# EasyEDA Pro project ProProject_F4_2025-05-21.epro, schematic Schematic1
Create Date: 2024-11-06; Page Name: P1; Project Name: 25电赛备赛; Schematic Name: Schematic1; Update Date: 2024-12-28; Company: 嘉立创EDA; Page Size: A4; Version: V1.0
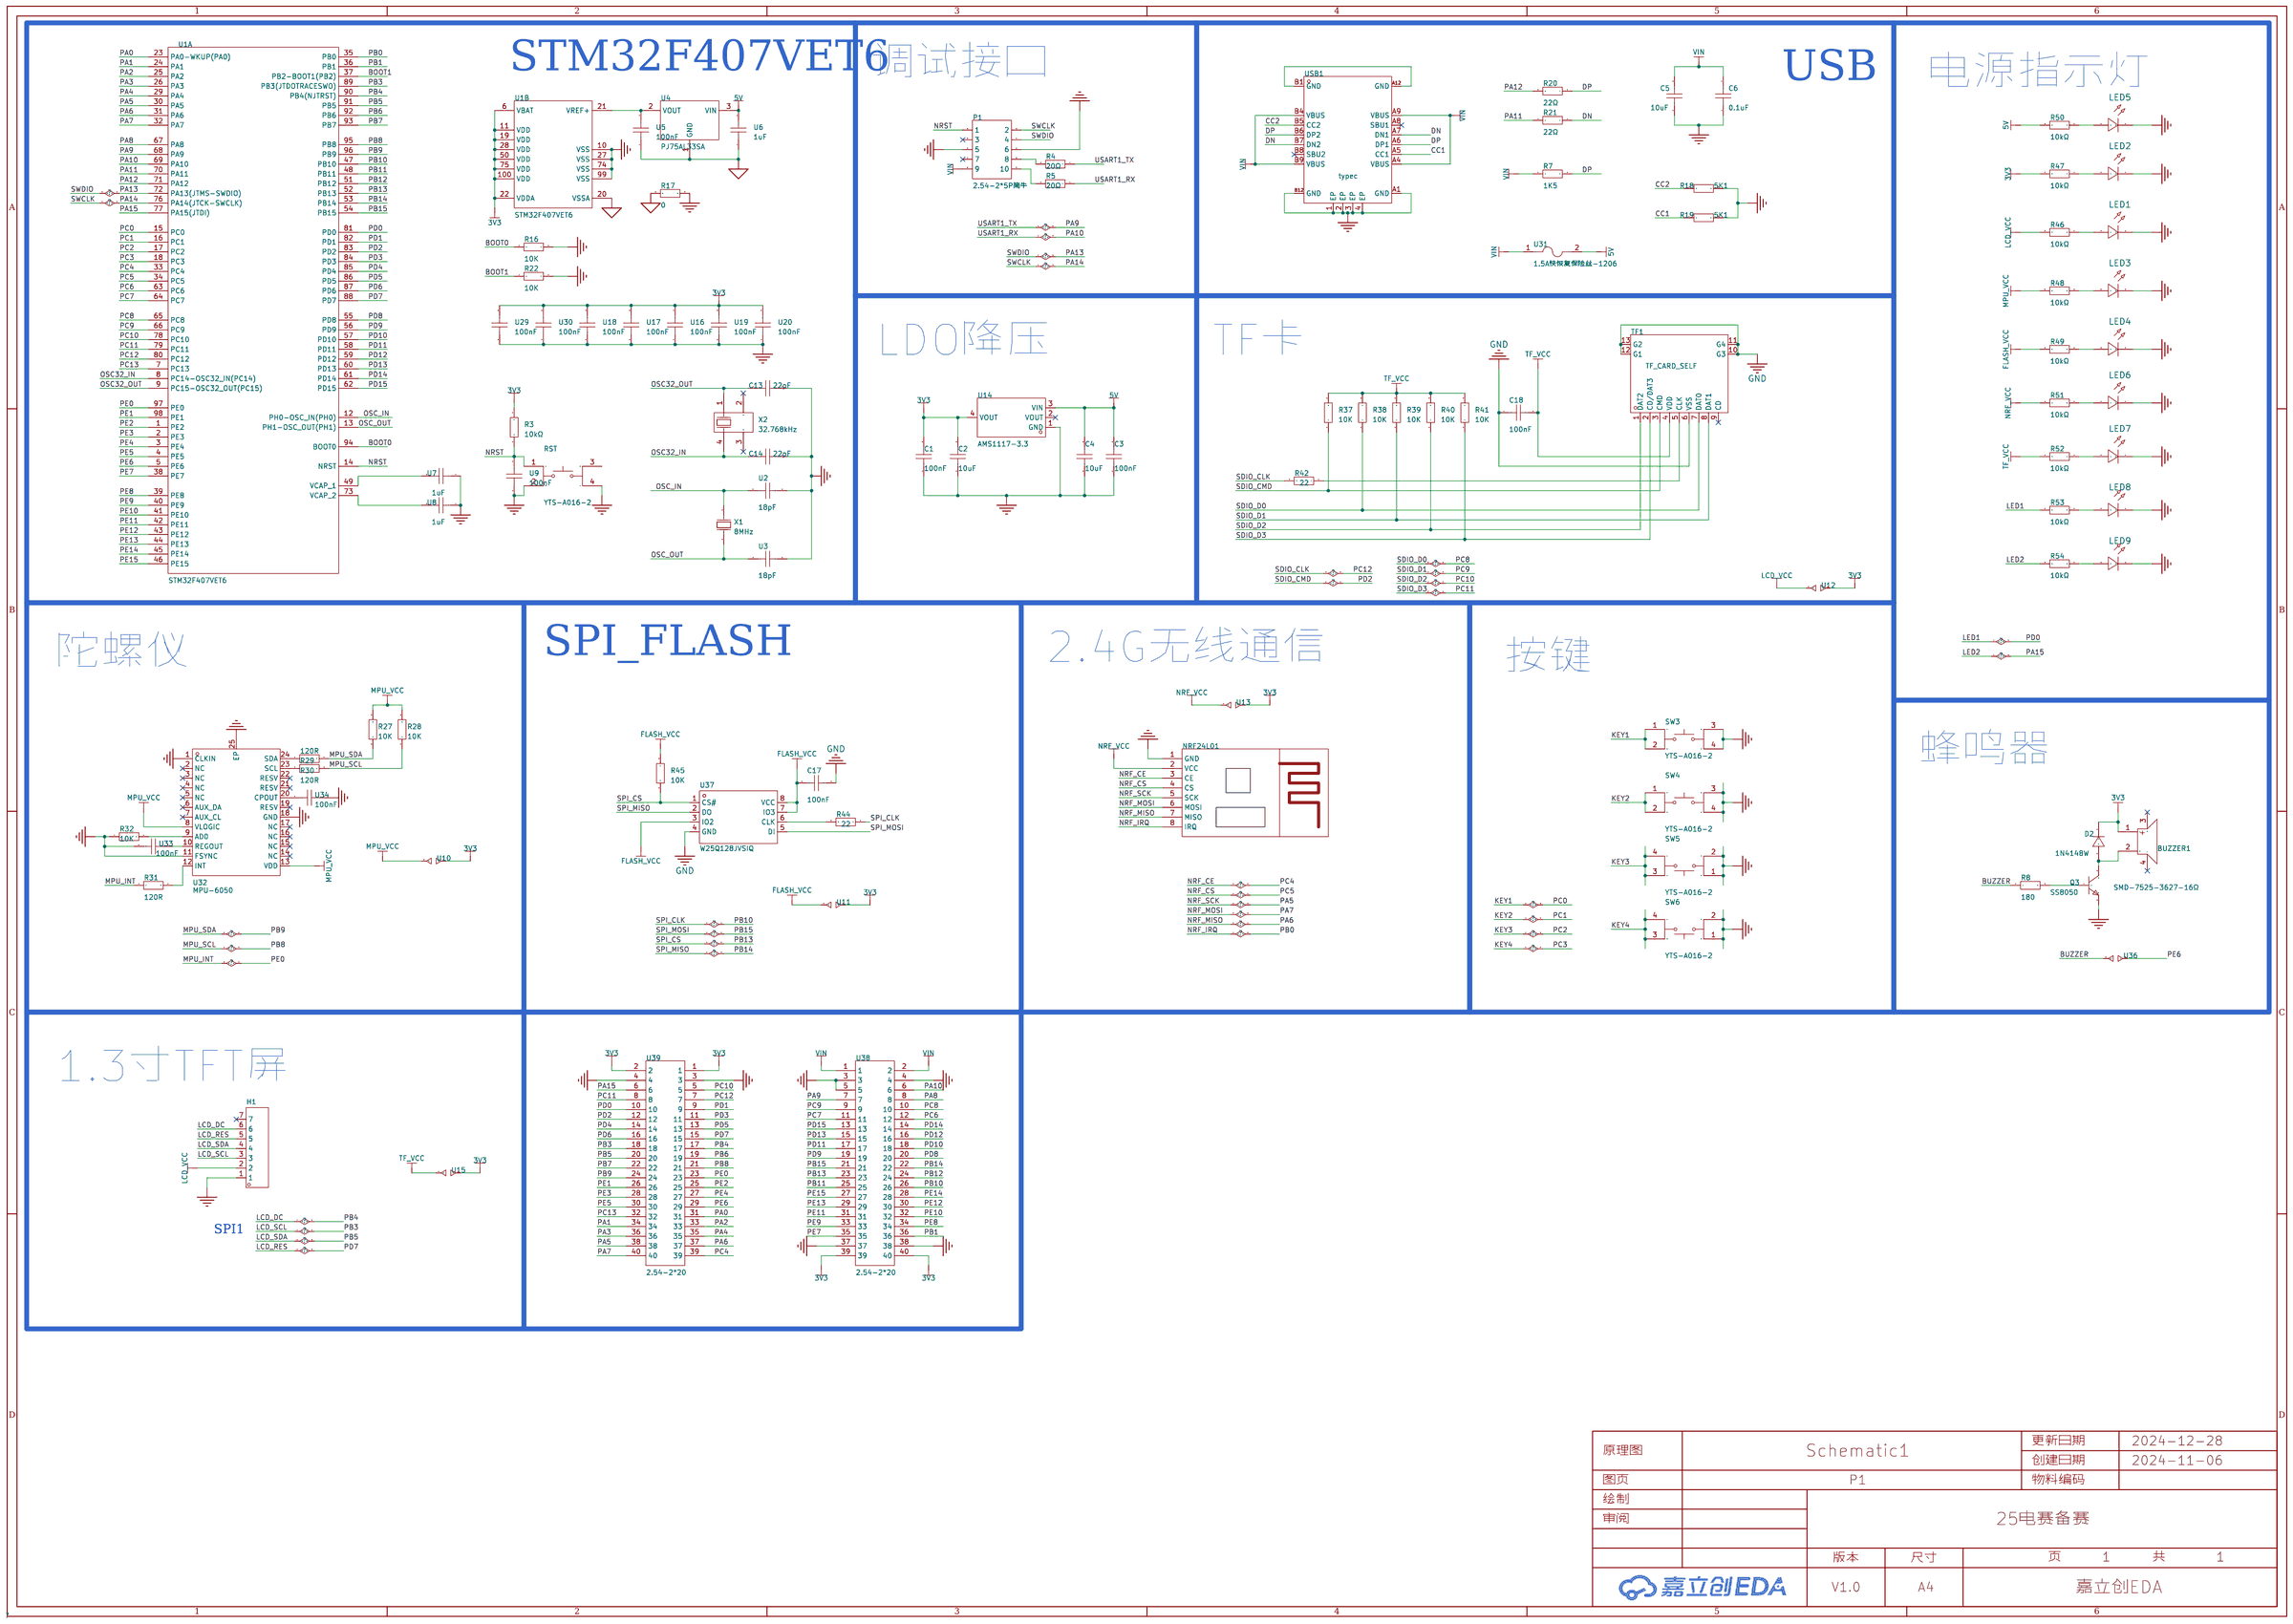
[diagram p1: schematic sheet]

## Parts
BUZZER1  SMD-7525-3627-16Ω  [BUZ-SMD_4P-L7.5-W7.5-BR]
C1  100nF  [C0603]
C2  10uF  [C0603]
C3  100nF  [C0603]
C4  10uF  [C0603]
C5  10uF  [C0603]
C6  0.1uF  [C0603]
C13  22pF  [C0603]
C14  22pF  [C0603]
C17  100nF  [C0603]
C18  100nF  [C0603]
D2  1N4148W  [SOD-123F_L2.7-W1.6-LS3.8-RD]
H1  -  [HDR-TH_7P-P2.54-V-F]
LED1  -  [LED_0603]
LED2  -  [LED_0603]
LED3  -  [LED_0603]
LED4  -  [LED_0603]
LED5  -  [LED_0603]
LED6  -  [LED_0603]
LED7  -  [LED_0603]
LED8  -  [LED_0603]
LED9  -  [LED_0603]
NRF24L01  -  [NRF24L01]
P1  2.54-2*5P简牛  [简牛2*5-2.54]
Q3  SS8050  [SOT-23-3_L2.9-W1.3-P1.90-LS2.4-BR]
R3  10kΩ  [R0603]
R4  20Ω  [R0603]
R5  20Ω  [R0603]
R7  1K5  [R0603]
R8  180  [R0603]
R16  10K  [R0603]
R17  0  [R0603]
R18  5K1  [R0603]
R19  5K1  [R0603]
R20  22Ω  [R0603]
R21  22Ω  [R0603]
R22  10K  [R0603]
R27  10K  [R0603]
R28  10K  [R0603]
R29  120R  [R0603]
R30  120R  [R0603]
R31  120R  [R0603]
R32  10K  [R0603]
R37  10K  [R0603]
R38  10K  [R0603]
R39  10K  [R0603]
R40  10K  [R0603]
R41  10K  [R0603]
R42  22  [R0603]
R44  22  [R0603]
R45  10K  [R0603]
R46  10kΩ  [R0603]
R47  10kΩ  [R0603]
R48  10kΩ  [R0603]
R49  10kΩ  [R0603]
R50  10kΩ  [R0603]
R51  10kΩ  [R0603]
R52  10kΩ  [R0603]
R53  10kΩ  [R0603]
R54  10kΩ  [R0603]
RST  YTS-A016-2  [SW-SMD_4P-L4.2-W3.3-P2.15-LS4.7]
SW3  YTS-A016-2  [SW-SMD_4P-L4.2-W3.3-P2.15-LS4.7]
SW4  YTS-A016-2  [SW-SMD_4P-L4.2-W3.3-P2.15-LS4.7]
SW5  YTS-A016-2  [SW-SMD_4P-L4.2-W3.3-P2.15-LS4.7]
SW6  YTS-A016-2  [SW-SMD_4P-L4.2-W3.3-P2.15-LS4.7]
TF1  TF_CARD_SELF  [TF-SMD_TF-15-15]
U1  STM32F407VET6  [LQFP-100_L14.0-W14.0-P0.50-LS16.0-BL]  (sections 1,2)
U2  18pF  [C0603]
U3  18pF  [C0603]
U4  PJ75AL33SA  [SOT-23_L2.9-W1.3-P1.90-LS2.4-BR]
U5  100nF  [C0603]
U6  1uF  [C0603]
U7  1uF  [C0603]
U8  1uF  [C0603]
U9  100nF  [C0603]
U10  -  [短接焊盘]  (no BOM)
U11  -  [短接焊盘]  (no BOM)
U12  -  [短接焊盘]  (no BOM)
U13  -  [短接焊盘]  (no BOM)
U14  AMS1117-3.3  [SOT-223-3_L6.5-W3.4-P2.30-LS7.0-BR]
U15  -  [短接焊盘]  (no BOM)
U16  100nF  [C0603]
U17  100nF  [C0603]
U18  100nF  [C0603]
U19  100nF  [C0603]
U20  100nF  [C0603]
U29  100nF  [C0603]
U30  100nF  [C0603]
U31  1.5A快恢复保险丝-1206  [F1206]
U32  MPU-6050  [QFN-24_L4.0-W4.0-P0.50-BL-EP2.7]
U33  100nF  [C0603]
U34  100nF  [C0603]
U36  -  [短接焊盘]  (no BOM)
U37  W25Q128JVSIQ  [SOIC-8_L5.3-W5.3-P1.27-LS8.0-BL]
U38  2.54-2*20  [HDR-TH_40P-P2.54-V-F-R2-C20-S2.54]
U39  2.54-2*20  [HDR-TH_40P-P2.54-V-F-R2-C20-S2.54]
USB1  typec  [USB-C-SMD_KH-TYPE-C-16P]
X1  8MHz  [OSC-SMD_L5.0-W3.2]
X2  32.768kHz  [OSC-SMD_4P-L8.0-W3.2-BL]

## Library data of the parts
BUZZER1 = SMD-7525-3627-16Ω: LCSC Part Name: 贴片无源蜂鸣器; Supplier Part: C2685546; Manufacturer: S&amp;S(海旭); Supplier Footprint: SMD,7.5x7.5mm; JLCPCB Part Class: 扩展库; Datasheet: https://atta.szlcsc.com/upload/public/pdf/source/20210114/C2685546_2D8B1F4F38CBC214AE254FB24EC16EED.pdf; Supplier: LCSC
C1-C6 C13 C14 C17 C18 = CAP_0603: Supplier Footprint: 0603
D2 = 1N4148W_C81598: 二极管配置:独立式;正向压降(Vf):1V@50mA;直流反向耐压(Vr):75V;平均整流电流(Io):150mA;功率:400mW;反向恢复时间(trr):4ns;; LCSC Part Name: 电压:75V 电流:150mA; Supplier Part: C81598; Manufacturer: ST(先科); Supplier Footprint: SOD-123; JLCPCB Part Class: 基础库; Datasheet: https://atta.szlcsc.com/upload/public/pdf/source/20161024/1477288446905.pdf; Supplier: LCSC; Diode Configuration: 独立式; Forward Voltage (Vf@If): 1V@50mA; Reverse Voltage (Vr): 75V; Average Rectified Current (Io): 150mA; Power Dissipation: 400mW; Reverse Leakage Current: 1uA@75V; Reverse Recovery Time (trr): 4ns
H1 = HDR-F_2.54_1x7P: Supplier Part: C124418; Supplier Footprint: 插件
LED1-LED9 = LED_0603-R: Supplier Footprint: 0603
NRF24L01 = NRF24L01
P1 = 2.54-2*5P简牛: 连接器类型:简牛座;间距:2.54mm;结构:2x5P;封装形式:直插;行距:2.54mm;排数:2;每排PIN数:5;触头材质:-;触头镀层:-;; LCSC Part Name: 2.54mm 2x5P 排数:2 每排P数:5; Supplier Part: C5665; Manufacturer: BOOMELE(博穆精密); Supplier Footprint: 插件,P=2.54mm; JLCPCB Part Class: 扩展库; Datasheet: https://atta.szlcsc.com/upload/public/pdf/source/20140331/1457707037896.pdf; Supplier: LCSC; Connector Type: 简牛座; Pitch: 2.54mm; Structure: 2x5P; Holder Type: 直插; Row Spacing: 2.54mm; Number of Rows: 2; Pin Number in each Row: 5
Q3 = SS8050_C2150: 晶体管类型:NPN;集电极电流(Ic):1.5A;集射极击穿电压(Vceo):25V;功率(Pd):300mW;直流电流增益(hFE@Ic,Vce):200@100mA,1V;; LCSC Part Name: SS8050(RANGE:200-350) hfe=200~350; Supplier Part: C2150; Manufacturer: CJ(江苏长电/长晶); Supplier Footprint: SOT-23; JLCPCB Part Class: 基础库; Datasheet: https://atta.szlcsc.com/upload/public/pdf/source/20230322/AEE86F4B043774EFF80CAEA14A37D9E9.pdf; Supplier: LCSC; Transistor Type: NPN; Collector Current (Ic): 1.5A; Collector-Emitter Breakdown Voltage (Vceo): 25V; Power Dissipation (Pd): 300mW; DC Current Gain (hFE@Ic,Vce): 200@100mA,1V; Transition Frequency (fT): 100MHz; Collector Cut-Off Current (Icbo): 100nA; Collector-Emitter Saturation Voltage (VCE(sat)@Ic,Ib): 500mV@800mA,80mA
R3-R5 R20 R21 R46-R54 = 0603WAF1002T5E: 电阻类型:厚膜电阻;阻值:10kΩ;精度:±1%;功率:100mW;最大工作电压:75V;温度系数:±100ppm/℃;; LCSC Part Name: 厚膜电阻 10kΩ ±1% 100mW; Supplier Part: C25804; Manufacturer: UNI-ROYAL(厚声); Supplier Footprint: 0603; JLCPCB Part Class: 基础库; Datasheet: https://atta.szlcsc.com/upload/public/pdf/source/20200306/C422600_1E6D84923E4A46A82E41ADD87F860B5C.pdf; Supplier: LCSC; Type: 厚膜电阻; Tolerance: ±1%; Power(Watts): 100mW; Overload Voltage (Max): 75V; Temperature Coefficient: ±100ppm/℃; Operating Temperature Range: -55℃~+155℃
R7 R8 R16-R19 R22 R27-R32 R37-R42 R44 R45 = Res_0603: Supplier Footprint: 0603
RST SW3-SW6 = YTS-A016-2: 电路结构:单刀单掷;按钮形状:椭圆形按钮;作用力:2.6N;安装方式:立贴;开关长度:4.2mm;开关宽度:3.4mm;开关高度:2.5mm;带支架:不带;触点电流:50mA;额定电压(DC):12V;绝缘电阻:100MΩ;机械寿命:10万次;; LCSC Part Name: 4.2*3.4*2.5mm 立贴 轻触开关; Supplier Part: C2910673; Manufacturer: YIYUAN(怡远); Supplier Footprint: SMD; JLCPCB Part Class: 扩展库; Datasheet: https://atta.szlcsc.com/upload/public/pdf/source/20211104/F07B7201482F381EAEC9C23BE16B5334.pdf; Supplier: LCSC; Circuit: 单刀单掷; Actuator Style: 椭圆形按钮; Operating Force: 2.6N; Mounting Style: 立贴; Switch Length: 4.2mm; Switch Width: 3.4mm; Switch Height: 2.5mm; Strike Gundam: 不带; Contact Current: 50mA; Voltage Rating (DC): 12V; Insulation Resistance: 100MΩ; Actuator/Cap Color: 白色; Pin Style: J型引脚; Mechanical Life: 10万次
TF1 = TF_CARD_SELF: Supplier Part: C9900010414; Supplier Footprint: TFCARD; JLCPCB Part Class: 扩展库; Supplier: LCSC
U1 = STM32F407VET6: CPU内核:CM4;程序存储容量:512KB;RAM总容量:192KB;GPIO端口数量:82;工作电压范围:1.8V~3.6V;CPU最大主频:168MHz;程序存储器类型:FLASH;; Supplier Part: C28730; Manufacturer: ST(意法半导体); Supplier Footprint: LQFP-100(14x14); JLCPCB Part Class: 扩展库; Datasheet: https://atta.szlcsc.com/upload/public/pdf/source/20140801/1457707197138.pdf; Supplier: LCSC; CPU Core: CM4; Program Storage Size: 512KB; RAM Size: 192KB; GPIO Ports Number: 82; Operating Voltage Range: 1.8V~3.6V; CPU Maximum Speed: 168MHz; Program Memory Type: FLASH; Operating Temperature Range: -40℃~+85℃; ADC (Bit): 12bit; DAC (Bit): 12bit; Universal Serial Bus: 有; Peripheral/Function: DMA；LCD/LED驱动；PWM; Watchdog: 有; Infrared Data Association: 有; Low-Voltage Detect: 有; LCD Module: 有; Direct Memory Access: 有; Internal Oscillator: 有
U2 U3 U5-U9 U16-U20 U29 U30 U33 U34 = 0603DS475K160NT: LCSC Part Name: 贴片电容; Supplier Part: C18213190; Manufacturer: FH(风华); Supplier Footprint: 0603; JLCPCB Part Class: Extended Part; Datasheet: https://atta.szlcsc.com/upload/public/pdf/source/20220211/3FDF6092789FC56E23A16E03DC7301F9.pdf; Supplier: LCSC
U4 = PJ75AL33SA: 输出类型:固定;最大输入电压:36V;输出电压:3.3V;最大输出电流:100mA;电源纹波抑制比(PSRR):-;输出极性:正极;; LCSC Part Name: 输入36V 输出3.3V 100mA; Supplier Part: C411736; Manufacturer: PJSEMI(平晶微); Supplier Footprint: SOT-23; JLCPCB Part Class: 扩展库; Datasheet: https://atta.szlcsc.com/upload/public/pdf/source/20190819/C411736_AA59BFC75038658DA9B87B4772B68F3A.pdf; Supplier: LCSC; Output Type: 固定; Maximum Input Voltage: 36V; Output Voltage: 3.3V; MAX Output Current: 100mA; Dropout Voltage: 55mV@(1mA); standby current: 3uA; Operating Temperature: -40℃~+85℃@(Ta); Output Polarity: 正极; Number of Outputs: 1
U10-U13 U15 U36 = 短接焊盘
U14 = AMS1117-3.3_C6186: 输出类型:固定;最大输入电压:-;输出电压:3.3V;最大输出电流:1A;电源纹波抑制比(PSRR):72dB@(120Hz);输出极性:正极;; LCSC Part Name: 输出3.3V 1A; Supplier Part: C6186; Manufacturer: AMS; Supplier Footprint: SOT-223-3; JLCPCB Part Class: 基础库; Datasheet: https://atta.szlcsc.com/upload/public/pdf/source/20180727/C6186_7A095716F0823C02F1997A905E26C086.pdf; Supplier: LCSC; Output Type: 固定; Output Voltage: 3.3V; MAX Output Current: 1A; Power Supply Rejection Ratio (PSRR): 72dB@(120Hz); Dropout Voltage: 1.3V@(800mA); Output Polarity: 正极; Number of Outputs: 1
U31 = 1.5A快恢复保险丝-1206: Supplier Part: C9900012139; JLCPCB Part Class: 扩展库; Supplier: LCSC
U32 = MPU-6050: 传感器类型:加速度计陀螺仪;; Supplier Part: C24112; Manufacturer: TDK InvenSense(应美盛); Supplier Footprint: QFN-24-EP(4x4); JLCPCB Part Class: 扩展库; Datasheet: https://atta.szlcsc.com/upload/public/pdf/source/20140425/1457707046159.pdf; Supplier: LCSC; Sensor Type: 加速度计陀螺仪; Operating Temperature: -40℃~+85℃
U37 = W25Q128JVSIQ: 接口类型:SPI;存储容量:128Mbit;时钟频率(fc):133MHz;; LCSC Part Name: W25Q128JVSIQ 编带; Supplier Part: C97521; Manufacturer: WINBOND(华邦); Supplier Footprint: SOIC-8-208mil; JLCPCB Part Class: 基础库; Datasheet: https://atta.szlcsc.com/upload/public/pdf/source/20170316/1489627409956.pdf; Supplier: LCSC; Interface Type: SPI; Memory Size: 128Mbit; Clock Frequency (fc): 133MHz; Supply Voltage: 2.7V~3.6V; Page Programming Time (Tpp): 700us; Block Erase Time (tBE): 120ms@(32KB); Data Retention - TDR (Year): 20年; Operating Temperature: -40℃~+85℃
U38 U39 = 2.54-2*20: 插孔结构:2x20P;间距:2.54mm;行距:2.54mm;圆孔/方孔:方孔;安装类型:直插;排数:双排;总孔位数:40P;额定电流:2.5A;额定电压:-;插孔方向:顶部;塑高:8.5mm;工作温度范围:-40℃~+105℃;; LCSC Part Name: 间距:2.54mm 2x20P 直插; Supplier Part: C2977589; Manufacturer: ZHOURI(洲日); Supplier Footprint: 插件,P=2.54mm; Datasheet: https://atta.szlcsc.com/upload/public/pdf/source/20220328/834E302BE3C038BBC5C70F5E02589B1E.pdf; Supplier: LCSC; Holes Structure: 2x20P; Pitch: 2.54mm; Row Spacing: 2.54mm; Circular Hole / Square Hole: 方孔; Mounting Type: 直插; Number of Rows: 双排; Number of Holes: 40P; Current Rating (Max): 2.5A; Holes Direction: 顶部; Insulation Height: 8.5mm; Operating Temperature Range: -40℃~+105℃
USB1 = typec: Supplier Part: C9900016956; Supplier Footprint: typec 12p; Supplier: LCSC
X1 = 7A08070001: 晶振类型:贴片晶振;频率:8MHz;常温频差:±30ppm;外接负载电容:18pF;; LCSC Part Name: 8MHz ±30ppm 18pF; Supplier Part: C337570; Manufacturer: TXC(晶技); Supplier Footprint: SMD5032-2P; JLCPCB Part Class: 扩展库; Datasheet: https://atta.szlcsc.com/upload/public/pdf/source/20190801/C337570_7AFB1DE5517D82B979390E5E5F727F5B.pdf; Supplier: LCSC; Crystal Type: 贴片晶振; Normal temperature Frequency Tolerance: ±30ppm; External load capacitor: 18pF; Equivalent Series Resistance (ESR): 60Ω; Operating Temperature: -20℃~+70℃
X2 = 6LC32768F06UC: 晶振类型:贴片晶振;频率:32.768kHz;常温频差:±20ppm;外接负载电容:6pF;; LCSC Part Name: 32.768kHz ±20ppm 6pF; Supplier Part: C252402; Manufacturer: SJK(晶科鑫); Supplier Footprint: MC-306; Datasheet: https://atta.szlcsc.com/upload/public/pdf/source/20220727/5C292F3C0D8F0FBE7B3326D83225472B.pdf; Supplier: LCSC; Crystal Type: 贴片晶振; Normal temperature Frequency Tolerance: ±20ppm; External load capacitor: 6pF; Operating Temperature: -40℃~+85℃

## Nets
3V3: BUZZER1.1 C1.2 C2.2 D2.1(K) R3.2 R47.2 U1.6(VBAT) U1.11(VDD) U1.19(VDD) U1.22(VDDA) U1.28(VDD) U1.50(VDD) U1.75(VDD) U1.100(VDD) U10.1 U11.1 U12.1 U13.1 U14.4(VOUT) U15.1 U16.2 U17.2 U18.2 U19.2 U20.2 U29.2 U30.2 U38.39 U38.40 U39.1 U39.2
5V: C3.2 C4.2 R50.2 U4.3(VIN) U6.2 U14.3(VIN) U31.2
AGND: R17.1 U1.20(VSSA) U4.1(GND) U5.1 U6.1
GND: C1.1 C2.1 C3.1 C4.1 C5.1 C6.1 C13.2 C14.2 C17.2 C18.1 H1.1 LED1.1(C) LED2.1(C) LED3.1(C) LED4.1(C) LED5.1(C) LED6.1(C) LED7.1(C) LED8.1(C) LED9.1(C) NRF24L01.1(GND) P1.5 P1.6 Q3.2(E) R16.2 R17.2 R18.2 R19.2 R22.2 R32.1 RST.2 RST.4 SW3.3 SW3.4 SW4.3 SW4.4 SW5.1 SW5.2 SW6.1 SW6.2 TF1.6(VSS) TF1.10(G3) TF1.11(G4) TF1.12(G1) TF1.13(G2) U1.10(VSS) U1.27(VSS) U1.74(VSS) U1.99(VSS) U2.2 U3.2 U7.1 U8.1 U9.1 U14.1(GND) U16.1 U17.1 U18.1 U19.1 U20.1 U29.1 U30.1 U32.1(CLKIN) U32.11(FSYNC) U32.18(GND) U32.25(EP) U33.2 U34.1 U37.4(GND) U38.3 U38.4 U38.5 U38.37 U38.38 U39.3 U39.4 USB1.1(EP) USB1.2(EP) USB1.3(EP) USB1.4(EP) USB1.A1(GND) USB1.B12(GND)
VIN: C5.2 C6.2 P1.9 R7.1 U31.1 U38.1 U38.2 USB1.A4(VBUS) USB1.A9(VBUS) USB1.B4(VBUS) USB1.B9(VBUS)
BOOT0: R16.1 U1.94(BOOT0)
BOOT1: R22.1 U1.37(PB2-BOOT1(PB2))
BUZZER: R8.1 U36.2
CC1: R19.1 USB1.A5(CC1)
CC2: R18.1 USB1.B5(CC2)
DN: R21.1 USB1.A7(DN1) USB1.B7(DN2)
DP: R7.2 R20.1 USB1.A6(DP1) USB1.B6(DP2)
FLASH_VCC: C17.1 R45.2 R49.2 U11.2 U37.3(IO2) U37.7(IO3) U37.8(VCC)
KEY1: SW3.1 SW3.2 U1.15(PC0)
KEY2: SW4.1 SW4.2 U1.16(PC1)
KEY3: SW5.3 SW5.4 U1.17(PC2)
KEY4: SW6.3 SW6.4 U1.18(PC3)
LCD_DC: H1.6 U1.90(PB4(NJTRST)) U39.17
LCD_RES: H1.5 U1.88(PD7) U39.15
LCD_SCL: H1.3 U1.89(PB3(JTDOTRACESWO)) U39.18
LCD_SDA: H1.4 U1.91(PB5) U39.20
LCD_VCC: H1.2 R46.2 U12.2
LED1: R53.2 U1.81(PD0) U39.10
LED2: R54.2 U1.77(PA15(JTDI)) U39.6
MPU_INT: R31.1 U1.97(PE0) U39.23
MPU_SCL: R28.1 R30.2 U1.95(PB8) U39.21
MPU_SDA: R27.1 R29.2 U1.96(PB9) U39.24
MPU_VCC: R27.2 R28.2 R48.2 U10.2 U32.8(VLOGIC) U32.13(VDD)
NRF_CE: NRF24L01.3(CE) U1.33(PC4) U39.39
NRF_CS: NRF24L01.4(CS) U1.34(PC5)
NRF_IRQ: NRF24L01.8(IRQ) U1.35(PB0)
NRF_MISO: NRF24L01.7(MISO) U1.31(PA6) U39.37
NRF_MOSI: NRF24L01.6(MOSI) U1.32(PA7) U39.40
NRF_SCK: NRF24L01.5(SCK) U1.30(PA5) U39.38
NRF_VCC: NRF24L01.2(VCC) R51.2 U13.2
NRST: P1.1 R3.1 RST.1 U1.14(NRST) U9.2
OSC32_IN: C14.1 U1.8(PC14-OSC32_IN(PC14)) X2.4
OSC32_OUT: C13.1 U1.9(PC15-OSC32_OUT(PC15)) X2.1
OSC_IN: U1.12(PH0-OSC_IN(PH0)) U2.1 X1.2(OSC2)
OSC_OUT: U1.13(PH1-OSC_OUT(PH1)) U3.1 X1.1(OSC1)
PA0: U1.23(PA0-WKUP(PA0)) U39.31
PA1: U1.24(PA1) U39.34
PA2: U1.25(PA2) U39.33
PA3: U1.26(PA3) U39.36
PA4: U1.29(PA4) U39.35
PA8: U1.67(PA8) U38.8
PA9: R4.1 U1.68(PA9) U38.7
PA10: R5.1 U1.69(PA10) U38.6
PA11: R21.2 U1.70(PA11)
PA12: R20.2 U1.71(PA12)
PA13: P1.4 U1.72(PA13(JTMS-SWDIO))
PA14: P1.2 U1.76(PA14(JTCK-SWCLK))
PB1: U1.36(PB1) U38.36
PB6: U1.92(PB6) U39.19
PB7: U1.93(PB7) U39.22
PB10: R44.1 U1.47(PB10) U38.26
PB11: U1.48(PB11) U38.25
PB12: U1.51(PB12) U38.24
PB13: R45.1 U1.52(PB13) U37.1(CS#) U38.23
PB14: U1.53(PB14) U37.2(DO) U38.22
PB15: U1.54(PB15) U37.5(DI) U38.21
PC6: U1.63(PC6) U38.12
PC7: U1.64(PC7) U38.11
PC8: R38.1 TF1.7(DAT0) U1.65(PC8) U38.10
PC9: R39.1 TF1.8(DAT1) U1.66(PC9) U38.9
PC10: R40.1 TF1.1(DAT2) U1.78(PC10) U39.5
PC11: R41.1 TF1.2(CD/DAT3) U1.79(PC11) U39.8
PC12: R42.2 U1.80(PC12) U39.7
PC13: U1.7(PC13) U39.32
PD1: U1.82(PD1) U39.9
PD2: R37.1 TF1.3(CMD) U1.83(PD2) U39.12
PD3: U1.84(PD3) U39.11
PD4: U1.85(PD4) U39.14
PD5: U1.86(PD5) U39.13
PD6: U1.87(PD6) U39.16
PD8: U1.55(PD8) U38.20
PD9: U1.56(PD9) U38.19
PD10: U1.57(PD10) U38.18
PD11: U1.58(PD11) U38.17
PD12: U1.59(PD12) U38.16
PD13: U1.60(PD13) U38.15
PD14: U1.61(PD14) U38.14
PD15: U1.62(PD15) U38.13
PE1: U1.98(PE1) U39.26
PE2: U1.1(PE2) U39.25
PE3: U1.2(PE3) U39.28
PE4: U1.3(PE4) U39.27
PE5: U1.4(PE5) U39.30
PE6: U1.5(PE6) U36.1 U39.29
PE7: U1.38(PE7) U38.35
PE8: U1.39(PE8) U38.34
PE9: U1.40(PE9) U38.33
PE10: U1.41(PE10) U38.32
PE11: U1.42(PE11) U38.31
PE12: U1.43(PE12) U38.30
PE13: U1.44(PE13) U38.29
PE14: U1.45(PE14) U38.28
PE15: U1.46(PE15) U38.27
TF_VCC: C18.2 R37.2 R38.2 R39.2 R40.2 R41.2 R52.2 TF1.4(VDD) U15.2
$1N1608: U1.21(VREF+) U4.2(VOUT) U5.2
$1N1611: U1.49(VCAP_1) U7.2
$1N1612: U1.73(VCAP_2) U8.2
$1N2522: P1.8 R4.2
$1N2523: P1.10 R5.2
$1N3223: USB1.A12(GND) USB1.B1(GND)
$1N6488: R29.1 U32.24(SDA)
$1N6489: R30.1 U32.23(SCL)
$1N6494: R31.2 U32.12(INT)
$1N6499: R32.2 U32.9(AD0)
$1N6502: U32.10(REGOUT) U33.1
$1N6503: U32.20(CPOUT) U34.2
$1N11456: R44.2 U37.6(CLK)
$1N14653: BUZZER1.2 D2.2(A) Q3.3(C)
$1N14654: Q3.1(B) R8.2
$1N14893: LED1.2(A) R46.1
$1N14984: LED2.2(A) R47.1
$1N15078: LED3.2(A) R48.1
$1N15170: LED4.2(A) R49.1
$1N15262: LED5.2(A) R50.1
$1N15346: LED6.2(A) R51.1
$1N15427: LED7.2(A) R52.1
$1N15508: LED8.2(A) R53.1
$1N19655: R42.1 TF1.5(CLK)
$1N19842: LED9.2(A) R54.1

Not connected (* = marked no-connect by the designer): BUZZER1 3* 4*; H1 7*; P1 3* 7*; RST 3; TF1 9(CD)*; U14 2(VOUT)*; U32 2(NC)* 3(NC)* 4(NC)* 5(NC)* 6(AUX_DA)* 7(AUX_CL)* 14(NC)* 15(NC)* 16(NC)* 17(NC)* 19(RESV)* 21(RESV)* 22(RESV)*; USB1 A8(SBU1)* B8(SBU2)*; X2 2* 3*

## Notes on the sheet
- STM32F407VET6
- 调试接口
- USB
- 电源指示灯
- LDO降压
- TF卡
- 陀螺仪
- SPI_FLASH
- 2.4G无线通信
- 按键
- 蜂鸣器
- 1.3寸TFT屏
- SPI1
